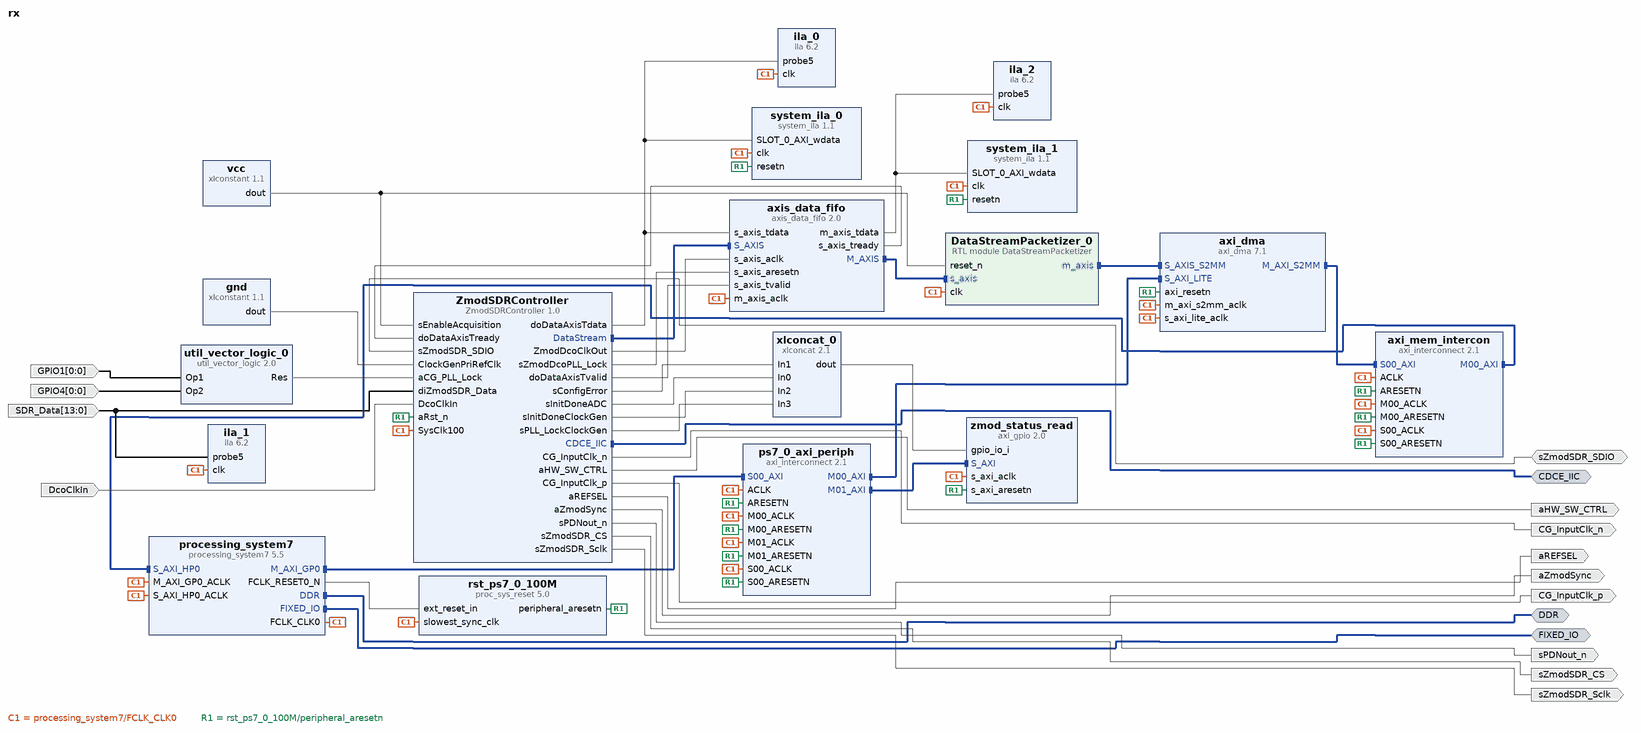
[diagram p0: block diagram of the top level]
# Vivado block design rx, xc7z020clg484-1, Vivado 2022.1
create_bd_design rx

create_bd_intf_port -mode Master -vlnv xilinx.com:interface:ddrx_rtl:1.0 DDR
create_bd_intf_port -mode Master -vlnv xilinx.com:display_processing_system7:fixedio_rtl:1.0 FIXED_IO
create_bd_intf_port -mode Master -vlnv xilinx.com:interface:iic_rtl:1.0 CDCE_IIC
create_bd_port -dir I -from 0 -to 0 GPIO1
create_bd_port -dir I -from 0 -to 0 GPIO4
create_bd_port -dir I -type clk DcoClkIn
set_property -dict {CONFIG.FREQ_TOLERANCE_HZ -1} [get_bd_ports DcoClkIn]
create_bd_port -dir I -from 13 -to 0 -type data SDR_Data
create_bd_port -dir O aZmodSync
create_bd_port -dir IO sZmodSDR_SDIO
create_bd_port -dir O sZmodSDR_CS
create_bd_port -dir O sZmodSDR_Sclk
create_bd_port -dir O CG_InputClk_p
create_bd_port -dir O CG_InputClk_n
create_bd_port -dir O aREFSEL
create_bd_port -dir O aHW_SW_CTRL
create_bd_port -dir O sPDNout_n

create_bd_cell -type ip -vlnv xilinx.com:ip:processing_system7:5.5 processing_system7
set_property -dict [list \
  CONFIG.PCW_ENET0_ENET0_IO {MIO 16 .. 27} \
  CONFIG.PCW_ENET0_GRP_MDIO_ENABLE 1 \
  CONFIG.PCW_ENET0_GRP_MDIO_IO {MIO 52 .. 53} \
  CONFIG.PCW_ENET0_PERIPHERAL_ENABLE 1 \
  CONFIG.PCW_ENET0_RESET_ENABLE 1 \
  CONFIG.PCW_ENET0_RESET_IO {MIO 9} \
  CONFIG.PCW_ENET_RESET_ENABLE 1 \
  CONFIG.PCW_ENET_RESET_SELECT {Share reset pin} \
  CONFIG.PCW_FPGA0_PERIPHERAL_FREQMHZ 100 \
  CONFIG.PCW_GPIO_MIO_GPIO_ENABLE 1 \
  CONFIG.PCW_GPIO_MIO_GPIO_IO MIO \
  CONFIG.PCW_I2C1_I2C1_IO {MIO 12 .. 13} \
  CONFIG.PCW_I2C1_PERIPHERAL_ENABLE 1 \
  CONFIG.PCW_I2C_PERIPHERAL_FREQMHZ 111.111115 \
  CONFIG.PCW_I2C_RESET_ENABLE 1 \
  CONFIG.PCW_I2C_RESET_SELECT {Share reset pin} \
  CONFIG.PCW_PRESET_BANK1_VOLTAGE {LVCMOS 1.8V} \
  CONFIG.PCW_QSPI_GRP_FBCLK_ENABLE 1 \
  CONFIG.PCW_QSPI_GRP_FBCLK_IO {MIO 8} \
  CONFIG.PCW_QSPI_GRP_SINGLE_SS_ENABLE 1 \
  CONFIG.PCW_QSPI_GRP_SINGLE_SS_IO {MIO 1 .. 6} \
  CONFIG.PCW_QSPI_PERIPHERAL_ENABLE 1 \
  CONFIG.PCW_QSPI_QSPI_IO {MIO 1 .. 6} \
  CONFIG.PCW_SD0_GRP_CD_ENABLE 1 \
  CONFIG.PCW_SD0_GRP_CD_IO {MIO 47} \
  CONFIG.PCW_SD0_GRP_WP_ENABLE 0 \
  CONFIG.PCW_SD0_PERIPHERAL_ENABLE 1 \
  CONFIG.PCW_SD0_SD0_IO {MIO 40 .. 45} \
  CONFIG.PCW_SDIO_PERIPHERAL_FREQMHZ 50 \
  CONFIG.PCW_SINGLE_QSPI_DATA_MODE x4 \
  CONFIG.PCW_UART0_PERIPHERAL_ENABLE 1 \
  CONFIG.PCW_UART0_UART0_IO {MIO 14 .. 15} \
  CONFIG.PCW_UART_PERIPHERAL_FREQMHZ 100 \
  CONFIG.PCW_UIPARAM_DDR_MEMORY_TYPE {DDR 3 (Low Voltage)} \
  CONFIG.PCW_UIPARAM_DDR_PARTNO {MT41K256M16 RE-125} \
  CONFIG.PCW_USB0_PERIPHERAL_ENABLE 1 \
  CONFIG.PCW_USB0_RESET_ENABLE 1 \
  CONFIG.PCW_USB0_RESET_IO {MIO 46} \
  CONFIG.PCW_USB0_USB0_IO {MIO 28 .. 39} \
  CONFIG.PCW_USB_RESET_ENABLE 1 \
  CONFIG.PCW_USB_RESET_SELECT {Share reset pin} \
  CONFIG.PCW_USE_S_AXI_HP0 1 \
] [get_bd_cells processing_system7]
# 267 more settings of processing_system7 are not shown: defaults, MIO pin electricals, DDR timing, and values the tool derives
create_bd_cell -type ip -vlnv xilinx.com:ip:axi_dma:7.1 axi_dma
set_property -dict [list \
  CONFIG.c_include_mm2s 0 \
  CONFIG.c_include_s2mm 1 \
  CONFIG.c_include_s2mm_dre 1 \
  CONFIG.c_include_sg 0 \
  CONFIG.c_micro_dma 0 \
] [get_bd_cells axi_dma]
create_bd_cell -type ip -vlnv xilinx.com:ip:axi_interconnect:2.1 ps7_0_axi_periph
set_property -dict {CONFIG.NUM_MI 2} [get_bd_cells ps7_0_axi_periph]
create_bd_cell -type ip -vlnv xilinx.com:ip:proc_sys_reset:5.0 rst_ps7_0_100M
create_bd_cell -type ip -vlnv xilinx.com:ip:axi_interconnect:2.1 axi_mem_intercon
set_property -dict {CONFIG.NUM_MI 1} [get_bd_cells axi_mem_intercon]
create_bd_cell -type ip -vlnv xilinx.com:ip:xlconstant:1.1 vcc
set_property -dict {CONFIG.CONST_VAL 1} [get_bd_cells vcc]
create_bd_cell -type ip -vlnv xilinx.com:ip:xlconstant:1.1 gnd
set_property -dict {CONFIG.CONST_VAL 0} [get_bd_cells gnd]
create_bd_cell -type ip -vlnv xilinx.com:ip:util_vector_logic:2.0 util_vector_logic_0
set_property -dict {CONFIG.C_SIZE 1} [get_bd_cells util_vector_logic_0]
create_bd_cell -type ip -vlnv xilinx.com:ip:axis_data_fifo:2.0 axis_data_fifo
set_property -dict {CONFIG.FIFO_DEPTH 64 CONFIG.FIFO_MODE 2 CONFIG.IS_ACLK_ASYNC 1} [get_bd_cells axis_data_fifo]
create_bd_cell -type ip -vlnv xilinx.com:ip:ila:6.2 ila_0
create_bd_cell -type ip -vlnv xilinx.com:ip:ila:6.2 ila_1
create_bd_cell -type ip -vlnv xilinx.com:ip:ila:6.2 ila_2
create_bd_cell -type ip -vlnv digilent.com:user:ZmodSDRController:1.0 ZmodSDRController
set_property -dict {CONFIG.kExtCmdInterfaceEn false} [get_bd_cells ZmodSDRController]
create_bd_cell -type ip -vlnv xilinx.com:ip:system_ila:1.1 system_ila_0
create_bd_cell -type ip -vlnv xilinx.com:ip:system_ila:1.1 system_ila_1
create_bd_cell -type ip -vlnv xilinx.com:ip:xlconcat:2.1 xlconcat_0
set_property -dict {CONFIG.NUM_PORTS 4} [get_bd_cells xlconcat_0]
create_bd_cell -type ip -vlnv xilinx.com:ip:axi_gpio:2.0 zmod_status_read
create_bd_cell -type module -reference DataStreamPacketizer DataStreamPacketizer_0

# ---- connections ----

connect_bd_intf_net [get_bd_intf_pins axi_dma/S_AXIS_S2MM] [get_bd_intf_pins DataStreamPacketizer_0/m_axis]
connect_bd_intf_net [get_bd_intf_pins axi_mem_intercon/S00_AXI] [get_bd_intf_pins axi_dma/M_AXI_S2MM]
connect_bd_intf_net -intf_net ZmodSDRController_0_CDCE_IIC [get_bd_intf_ports CDCE_IIC] [get_bd_intf_pins ZmodSDRController/CDCE_IIC]
connect_bd_intf_net -intf_net ZmodSDRController_0_DataStream [get_bd_intf_pins axis_data_fifo/S_AXIS] [get_bd_intf_pins ZmodSDRController/DataStream]
connect_bd_intf_net [get_bd_intf_pins axi_mem_intercon/M00_AXI] [get_bd_intf_pins processing_system7/S_AXI_HP0]
connect_bd_intf_net [get_bd_intf_pins axis_data_fifo/M_AXIS] [get_bd_intf_pins DataStreamPacketizer_0/s_axis]
connect_bd_intf_net -intf_net processing_system7_0_DDR [get_bd_intf_ports DDR] [get_bd_intf_pins processing_system7/DDR]
connect_bd_intf_net -intf_net processing_system7_0_FIXED_IO [get_bd_intf_ports FIXED_IO] [get_bd_intf_pins processing_system7/FIXED_IO]
connect_bd_intf_net -intf_net processing_system7_0_M_AXI_GP0 [get_bd_intf_pins processing_system7/M_AXI_GP0] [get_bd_intf_pins ps7_0_axi_periph/S00_AXI]
connect_bd_intf_net [get_bd_intf_pins ps7_0_axi_periph/M00_AXI] [get_bd_intf_pins axi_dma/S_AXI_LITE]
connect_bd_intf_net [get_bd_intf_pins ps7_0_axi_periph/M01_AXI] [get_bd_intf_pins zmod_status_read/S_AXI]
connect_bd_net -net DcoClkIn_1_1 [get_bd_ports DcoClkIn] [get_bd_pins ZmodSDRController/DcoClkIn]
connect_bd_net [get_bd_ports sZmodSDR_SDIO] [get_bd_pins ZmodSDRController/sZmodSDR_SDIO]
connect_bd_net -net Op1_0_1 [get_bd_ports GPIO1] [get_bd_pins util_vector_logic_0/Op1]
connect_bd_net -net Op2_0_1 [get_bd_ports GPIO4] [get_bd_pins util_vector_logic_0/Op2]
connect_bd_net -net ZmodSDRController_0_CG_InputClk_n [get_bd_pins ZmodSDRController/CG_InputClk_n] [get_bd_ports CG_InputClk_n]
connect_bd_net -net ZmodSDRController_0_CG_InputClk_p [get_bd_pins ZmodSDRController/CG_InputClk_p] [get_bd_ports CG_InputClk_p]
connect_bd_net -net ZmodSDRController_0_ZmodDcoClkOut [get_bd_pins ZmodSDRController/ZmodDcoClkOut] [get_bd_pins axis_data_fifo/s_axis_aclk]
connect_bd_net -net ZmodSDRController_0_aHW_SW_CTRL [get_bd_pins ZmodSDRController/aHW_SW_CTRL] [get_bd_ports aHW_SW_CTRL]
connect_bd_net -net ZmodSDRController_0_aREFSEL [get_bd_pins ZmodSDRController/aREFSEL] [get_bd_ports aREFSEL]
connect_bd_net -net ZmodSDRController_0_aZmodSync [get_bd_pins ZmodSDRController/aZmodSync] [get_bd_ports aZmodSync]
connect_bd_net -net ZmodSDRController_0_doDataAxisTdata [get_bd_pins ZmodSDRController/doDataAxisTdata] \
  [get_bd_pins ila_0/probe5] [get_bd_pins system_ila_0/SLOT_0_AXI_wdata] [get_bd_pins axis_data_fifo/s_axis_tdata]
connect_bd_net -net ZmodSDRController_0_sPDNout_n [get_bd_pins ZmodSDRController/sPDNout_n] [get_bd_ports sPDNout_n]
connect_bd_net -net ZmodSDRController_0_sZmodDcoPLL_Lock [get_bd_pins ZmodSDRController/sZmodDcoPLL_Lock] [get_bd_pins axis_data_fifo/s_axis_aresetn]
connect_bd_net -net ZmodSDRController_0_sZmodSDR_CS [get_bd_pins ZmodSDRController/sZmodSDR_CS] [get_bd_ports sZmodSDR_CS]
connect_bd_net -net ZmodSDRController_0_sZmodSDR_Sclk [get_bd_pins ZmodSDRController/sZmodSDR_Sclk] [get_bd_ports sZmodSDR_Sclk]
connect_bd_net [get_bd_pins ZmodSDRController/doDataAxisTvalid] [get_bd_pins axis_data_fifo/s_axis_tvalid]
connect_bd_net [get_bd_pins ZmodSDRController/sConfigError] [get_bd_pins xlconcat_0/In1]
connect_bd_net [get_bd_pins ZmodSDRController/sInitDoneADC] [get_bd_pins xlconcat_0/In0]
connect_bd_net [get_bd_pins ZmodSDRController/sInitDoneClockGen] [get_bd_pins xlconcat_0/In2]
connect_bd_net [get_bd_pins ZmodSDRController/sPLL_LockClockGen] [get_bd_pins xlconcat_0/In3]
connect_bd_net -net axis_data_fifo_0_m_axis_tdata [get_bd_pins axis_data_fifo/m_axis_tdata] \
  [get_bd_pins ila_2/probe5] [get_bd_pins system_ila_1/SLOT_0_AXI_wdata]
connect_bd_net [get_bd_pins axis_data_fifo/s_axis_tready] [get_bd_pins ZmodSDRController/doDataAxisTready]
connect_bd_net -net diZmodSDR_Data_0_1 [get_bd_ports SDR_Data] [get_bd_pins ZmodSDRController/diZmodSDR_Data] [get_bd_pins ila_1/probe5]
connect_bd_net [get_bd_pins gnd/dout] [get_bd_pins ZmodSDRController/ClockGenPriRefClk]
connect_bd_net -net processing_system7_0_FCLK_CLK0 [get_bd_pins processing_system7/FCLK_CLK0] \
  [get_bd_pins processing_system7/M_AXI_GP0_ACLK] [get_bd_pins ps7_0_axi_periph/S00_ACLK] \
  [get_bd_pins rst_ps7_0_100M/slowest_sync_clk] [get_bd_pins axi_dma/s_axi_lite_aclk] [get_bd_pins ps7_0_axi_periph/M00_ACLK] \
  [get_bd_pins ps7_0_axi_periph/ACLK] [get_bd_pins axi_mem_intercon/S00_ACLK] [get_bd_pins processing_system7/S_AXI_HP0_ACLK] \
  [get_bd_pins axi_mem_intercon/M00_ACLK] [get_bd_pins axi_mem_intercon/ACLK] [get_bd_pins axis_data_fifo/m_axis_aclk] \
  [get_bd_pins axi_dma/m_axi_s2mm_aclk] [get_bd_pins ila_1/clk] [get_bd_pins ila_0/clk] [get_bd_pins ila_2/clk] \
  [get_bd_pins ZmodSDRController/SysClk100] [get_bd_pins system_ila_0/clk] [get_bd_pins system_ila_1/clk] \
  [get_bd_pins zmod_status_read/s_axi_aclk] [get_bd_pins ps7_0_axi_periph/M01_ACLK] [get_bd_pins DataStreamPacketizer_0/clk]
connect_bd_net -net processing_system7_0_FCLK_RESET0_N [get_bd_pins processing_system7/FCLK_RESET0_N] [get_bd_pins rst_ps7_0_100M/ext_reset_in]
connect_bd_net [get_bd_pins rst_ps7_0_100M/peripheral_aresetn] \
  [get_bd_pins ps7_0_axi_periph/S00_ARESETN] [get_bd_pins axi_dma/axi_resetn] [get_bd_pins ps7_0_axi_periph/M00_ARESETN] \
  [get_bd_pins ps7_0_axi_periph/ARESETN] [get_bd_pins axi_mem_intercon/S00_ARESETN] \
  [get_bd_pins axi_mem_intercon/M00_ARESETN] [get_bd_pins axi_mem_intercon/ARESETN] [get_bd_pins ZmodSDRController/aRst_n] \
  [get_bd_pins system_ila_0/resetn] [get_bd_pins system_ila_1/resetn] [get_bd_pins zmod_status_read/s_axi_aresetn] \
  [get_bd_pins ps7_0_axi_periph/M01_ARESETN]
connect_bd_net [get_bd_pins util_vector_logic_0/Res] [get_bd_pins ZmodSDRController/aCG_PLL_Lock]
connect_bd_net [get_bd_pins vcc/dout] [get_bd_pins ZmodSDRController/sEnableAcquisition] [get_bd_pins DataStreamPacketizer_0/reset_n]
connect_bd_net [get_bd_pins xlconcat_0/dout] [get_bd_pins zmod_status_read/gpio_io_i]
set_property PFM.AXI_PORT {M_AXI_GP1 {memport "M_AXI_GP" sptag "" memory "" is_range "false"} S_AXI_HP1 {memport "S_AXI_HP" sptag "" memory "" is_range "false"}} [get_bd_cells processing_system7]
set_property PFM.CLOCK {FCLK_CLK0 {id "0" is_default "true" proc_sys_reset "/rst_ps7_0_100M" status "fixed" freq_hz "100000000"}} [get_bd_cells processing_system7]

# ---- address map ----
assign_bd_address -offset 0x00000000 -range 1G -target_address_space [get_bd_addr_spaces axi_dma/Data_MM2S] [get_bd_addr_segs processing_system7/S_AXI_HP0/HP0_DDR_LOWOCM]
assign_bd_address -offset 0x00000000 -range 1G -target_address_space [get_bd_addr_spaces axi_dma/Data_S2MM] [get_bd_addr_segs processing_system7/S_AXI_HP0/HP0_DDR_LOWOCM]
assign_bd_address -offset 0x40400000 -range 64K -target_address_space [get_bd_addr_spaces processing_system7/Data] [get_bd_addr_segs axi_dma/S_AXI_LITE/Reg]
assign_bd_address -offset 0x41200000 -range 64K -target_address_space [get_bd_addr_spaces processing_system7/Data] [get_bd_addr_segs zmod_status_read/S_AXI/Reg]

validate_bd_design
save_bd_design
